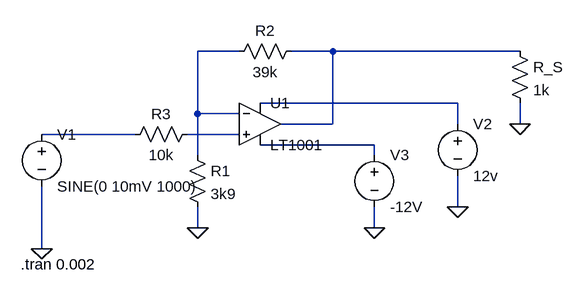
[diagram p0: schematic ne-inv.asc]
ne-inv.asc, the LTspice schematic file:
Version 4
SHEET 1 880 680
WIRE 176 48 112 48
WIRE 320 48 256 48
WIRE 608 48 320 48
WIRE 512 128 208 128
WIRE 112 144 112 48
WIRE 176 144 112 144
WIRE 320 160 320 48
WIRE 320 160 240 160
WIRE 512 160 512 128
WIRE 608 160 608 128
WIRE 16 176 -128 176
WIRE 176 176 96 176
WIRE 384 192 208 192
WIRE 112 208 112 144
WIRE 384 208 384 192
WIRE 512 288 512 240
WIRE 112 320 112 288
WIRE 384 320 384 288
WIRE -128 352 -128 256
FLAG -128 352 0
FLAG 512 288 0
FLAG 384 320 0
FLAG 608 160 0
FLAG 112 320 0
SYMBOL Opamps\\LT1001 208 96 R0
SYMATTR InstName U1
SYMBOL res 96 192 R0
SYMATTR InstName R1
SYMATTR Value 3k9
SYMBOL res 272 32 R90
WINDOW 0 0 56 VBottom 2
WINDOW 3 32 56 VTop 2
SYMATTR InstName R2
SYMATTR Value 39k
SYMBOL voltage -128 160 R0
WINDOW 123 0 0 Left 2
WINDOW 39 0 0 Left 2
SYMATTR InstName V1
SYMATTR Value SINE(0 10mV 1000)
SYMBOL voltage 512 144 R0
WINDOW 123 0 0 Left 2
WINDOW 39 0 0 Left 2
SYMATTR InstName V2
SYMATTR Value 12v
SYMBOL voltage 384 192 R0
WINDOW 123 0 0 Left 2
WINDOW 39 0 0 Left 2
SYMATTR InstName V3
SYMATTR Value -12V
SYMBOL res 592 32 R0
SYMATTR InstName R_S
SYMATTR Value 1k
SYMBOL res 112 160 R90
WINDOW 0 0 56 VBottom 2
WINDOW 3 32 56 VTop 2
SYMATTR InstName R3
SYMATTR Value 10k
TEXT -160 376 Left 2 !.tran 0.002

The netlist it stands for:
* ne-inv.asc
XU1 N005 N001 N003 N006 N002 LT1001  ; pins In+ In- V+ V- OUT
R1 N001 0 3k9
R2 N002 N001 39k
V1 N004 0 SINE(0 10mV 1000)
V2 N003 0 12v
V3 N006 0 -12V
R_S N002 0 1k
R3 N005 N004 10k
.tran 0.002
.lib LTC.lib
.backanno
.end